# Altium project ESP32-C3FH4-v1.2.PrjPcb
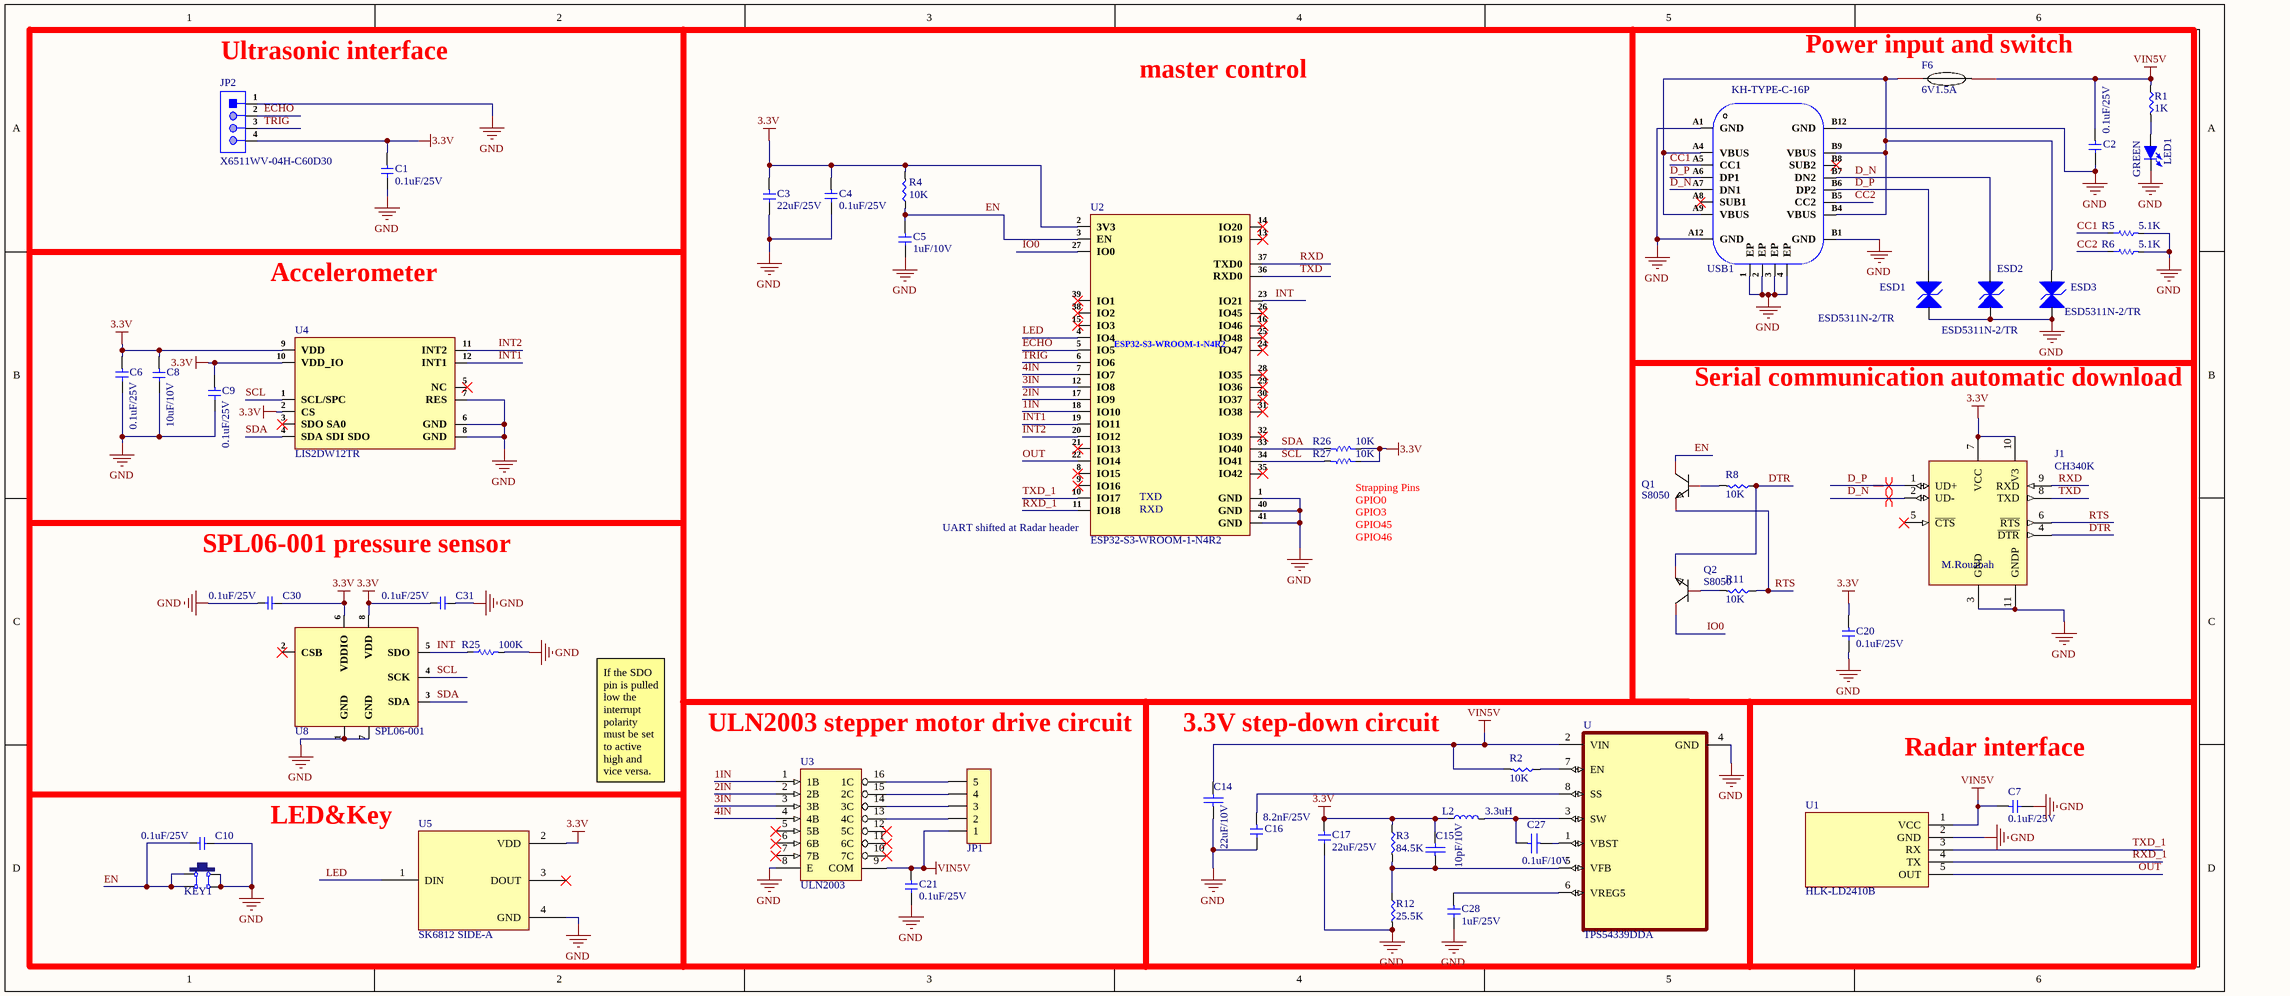
[diagram p0: ESP32-C3FH4.SchDoc]
1 sheet, 52 parts. Net scope: global (net labels, ports and power ports of the same name join across sheets).
Board file: ESP32-C3FH4-v1.2.PcbDoc

## Sheet ESP32-C3FH4.SchDoc
size 457 x 203 mm

### Parts
C1  0.1uF/25V  [C 0402_L]
C2  0.1uF/25V  [C 0402_L]
C3  22uF/25V  [C0805]
C4  0.1uF/25V  [C 0402_L]
C5  1uF/10V  [C 0402_L]
C6  0.1uF/25V  [C 0402_L]
C7  0.1uF/25V  [C 0402_L]
C8  10uF/10V  [C 0402_L]
C9  0.1uF/25V  [C 0402_L]
C10  0.1uF/25V  [C 0402_L]
C14  22uF/10V  [C 0402_L]
C15  10pF/10V  [C 0402_L]
C16  8.2nF/25V  [C 0402_L]
C17  22uF/25V  [C0805]
C20  0.1uF/25V  [C 0402_L]
C21  0.1uF/25V  [C 0402_L]
C27  0.1uF/10V  [C 0402_L]
C28  1uF/25V  [C 0402_L]
C30  0.1uF/25V  [C 0402_L]
C31  0.1uF/25V  [C 0402_L]
ESD1  ESD5311N-2/TR  [X1-DFN1006-2_L1.0-W0.6-RD]
ESD2  ESD5311N-2/TR  [X1-DFN1006-2_L1.0-W0.6-RD]
ESD3  ESD5311N-2/TR  [X1-DFN1006-2_L1.0-W0.6-RD]
F6  Name: 6V1.5A  [R 0805_L]  (hidden comment: 6V1A)
J1  CH340K  [*SOP100P600X160-11N]
JP1  HDR-1X5  [XH2.54-LI-5P]  (value not drawn)
JP2  X6511WV-04H-C60D30  [HDR1X4_]
KEY1  6*6*5  [TSW SMD-6*6*5]  (value not drawn)
L2  3.3uH  [VLS5045EX-3R3N]
LED1  GREEN  [LED 0603B]
Q1  S8050  [SOT23-3L]
Q2  S8050  [SOT23-3L]
R1  1K  [R 0402_L]
R2  10K  [R 0402_L]
R3  84.5K  [R 0402_L]
R4  10K  [R 0402_L]
R5  5.1K  [Res-0402]
R6  5.1K  [Res-0402]
R8  10K  [R 0402_L]
R11  10K  [R 0402_L]
R12  25.5K  [R 0402_L]
R25  100K  [Res-0402]
R26  10K  [R 0402_L]
R27  10K  [R 0402_L]
U  TPS54339DDA  [VREG_LM5017MR/NOPB]
U1  HLK-LD2410B  [HDR-TH_5P-P1.27-V-M]
U2  ESP32-S3-WROOM-1-N4R2  [41-SMD Module]
U3  ULN2003  [SOP16]
U4  LIS2DW12TR  [12-LGA (2x2)]
U5  SK6812 SIDE-A  [SK6812 SIDE-A]
U8  SPL06-001  [SPL06-001]
USB1  KH-TYPE-C-16P  [KH-TYPE-C-16P]

### Nets
3.3V: C1.1 C3.1 C4.1 C6.1 C8.1 C9.1 C15.2 C17.1 C20.1 C30.2 C31.1 J1.7(VCC) J1.10(V3) JP2.4 L2.1 R3.1 R4.2 R26.1 R27.1 U2.2(3V3) U4.2(CS) U4.9(VDD) U4.10(VDD_IO) U5.2(VDD) U8.6(VDDIO) U8.8(VDD)
GND: C1.2 C2.2 C3.2 C4.2 C5.2 C6.2 C7.2 C8.2 C9.2 C10.2 C14.1 C16.2 C17.2 C20.2 C21.2 C28.2 C30.1 C31.2 ESD1.1(K1) ESD2.1(K1) ESD3.1(K1) J1.3(GND) J1.11(GNDP) JP2.1 KEY1.1 KEY1.4 LED1.2(K) R5.2 R6.2 R12.2 R25.2 U.4(GND) U1.2(GND) U2.1(GND) U2.40(GND) U2.41(GND) U3.8(E) U4.6(GND) U4.7(RES) U4.8(GND) U5.4(GND) U8.1(GND) U8.7(GND) USB1.1(EP) USB1.2(EP) USB1.3(EP) USB1.4(EP) USB1.A1(GND) USB1.A12(GND) USB1.B1(GND) USB1.B12(GND)
VIN5V: C2.1 C7.1 C14.2 C21.1 F6.1 JP1.1 R1.1 R2.2 U.2(VIN) U1.1(VCC) U3.9(COM)
1IN: U2.18(IO10) U3.1(1B)
2IN: U2.17(IO9) U3.2(2B)
3IN: U2.12(IO8) U3.3(3B)
4IN: U2.7(IO7) U3.4(4B)
CC1: R5.1 USB1.A5(CC1)
CC2: R6.1 USB1.B5(CC2)
D_N: ESD2.2(K2) J1.2(UD-) USB1.A7(DN1) USB1.B7(DN2)
D_P: ESD1.2(K2) J1.1(UD+) USB1.A6(DP1) USB1.B6(DP2)
DTR: J1.4(~{DTR}) Q2.2(E) R8.1
ECHO: JP2.2 U2.5(IO5)
EN: C5.1 C10.1 KEY1.2 KEY1.3 Q1.3(C) R4.1 U2.3(EN)
INT: R25.1 U2.23(IO21) U8.5(SDO)
INT1: U2.19(IO11) U4.12(INT1)
INT2: U2.20(IO12) U4.11(INT2)
IO0: Q2.3(C) U2.27(IO0)
LED: U2.4(IO4) U5.1(DIN)
OUT: U1.5(OUT) U2.22(IO14)
RTS: J1.6(~{RTS}) Q1.2(E) R11.1
RXD: J1.9(RXD) U2.37(TXD0)
RXD_1: U1.4(TX) U2.11(IO18)
SCL: R27.2 U2.34(IO41) U4.1(SCL/SPC) U8.4(SCK)
SDA: R26.2 U2.33(IO40) U4.4(SDA_SDI_SDO) U8.3(SDA)
TRIG: JP2.3 U2.6(IO6)
TXD: J1.8(TXD) U2.36(RXD0)
TXD_1: U1.3(RX) U2.10(IO17)
NetC15_1: C15.1 R3.2 R12.1 U.5(VFB)
NetC16_1: C16.1 U.8(SS)
NetC27_1: C27.1 U.1(VBST)
NetC27_2: C27.2 L2.2 U.3(SW)
NetC28_1: C28.1 U.6(VREG5)
NetESD3_2: ESD3.2(K2) F6.2 USB1.A4(VBUS) USB1.A9(VBUS) USB1.B4(VBUS) USB1.B9(VBUS)
NetJP1_2: JP1.2 U3.13(4C)
NetJP1_3: JP1.3 U3.14(3C)
NetJP1_4: JP1.4 U3.15(2C)
NetJP1_5: JP1.5 U3.16(1C)
NetLED1_1: LED1.1(A) R1.2
NetQ1_1: Q1.1(B) R8.2
NetQ2_1: Q2.1(B) R11.2
NetR2_1: R2.1 U.7(EN)

Not connected (* = marked no-connect by the designer): J1 5(~{CTS})*; U2 8(IO15)* 9(IO16)* 13(IO19)* 14(IO20)* 15(IO3)* 16(IO46)* 21(IO13)* 24(IO47)* 25(IO48)* 26(IO45)* 28(IO35)* 29(IO36)* 30(IO37)* 31(IO38)* 32(IO39)* 35(IO42)* 38(IO2)* 39(IO1)*; U3 5(5B)* 6(6B)* 7(7B)* 10(7C)* 11(6C)* 12(5C)*; U4 3(SDO_SA0)* 5(NC)*; U5 3(DOUT)*; U8 2(CSB)*; USB1 A8(SUB1)* B8(SUB2)*

### Layout directives
differential pair; Impedance Constraint: Min = 88  Max = 90; Matched Net Lengths: Tolerance = 20 mil; net class USB; differential pair class USB_Lines: D_P
differential pair; Impedance Constraint: Min =88 Max = 90; Matched Net Lengths: Tolerance = 20 mil; net class USB; differential pair class USB_Lines: D_N

### Notes on the sheet
- (near JP2) Ultrasonic interface
- master control
- (near F6) Power input and switch
- Accelerometer
- Serial communication automatic download
- (near U2) TXD
- (near U2) RXD
- SPL06-001 pressure sensor
- (near U2) UART shifted at Radar header
- Strapping Pins
  GPIO0
  GPIO3
  GPIO45
  GPIO46
- ULN2003 stepper motor drive circuit
- 3.3V step-down circuit
- Radar interface
- LED&Key
- If the SDO
  pin is pulled low the interrupt polarity must be set to active high and vice versa.
- (in symbol CH340K) M.Rouabah

### Library data of the parts
C1-C9 C16 C17 C20 C21 C28 = C
C10 C30 C31 = Capacitor
C14 C15 C27 = Cap: Capacitor; Manufacturer: Generic Components; Class: Passive; Value: 15P; Published: 08/06/2000; Publisher: Altium Hobart Technology Centre; SubClass: Capacitor
ESD1-ESD3 = tvs管
F6 = JK-SMD0603-100L: Manufacturer: Jinrui Electronic Materials Co.; Convert to PCB: yes; Origin Footprint: F0603; Symbol: 6V1A; Device: JK-SMD0603-100L; Supplier: LCSC; Supplier Part: C516069; Manufacturer Part: JK-SMD0603-100L; JLCPCB Part Class: Extended Part; Add into BOM: yes
J1 = CH340K: USB to Serial Port Chip; MF: WCH; SnapEDA_Link: https://www.snapeda.com/parts/CH340K/WCH/view-part/?ref=snap; Package: Package; Value: *; MP: CH340K; Check_prices: https://www.snapeda.com/parts/CH340K/WCH/view-part/?ref=eda
JP1 = Header 5: 5P接插件; 版权归属: 源创客; BOM名称: 5P接插件; 学习资源: www.ooocke.com
JP2 = X6511WV-04H-C60D30: Gold 250V 3A Straight Square Pins 2.5mm 4P 260℃ 6mm -40℃~+105℃ 3mm 2.54mm Plugin Black Brass 1x4P Plugin,P=2.54mm Pin Headers ROHS; Manufacturer: XKB; Item Type: Male Header; ComponentLink1Description: LCSC; ComponentLink1URL: https://www.lcsc.com/product-detail/Pin-Headers_XKB-Connectivity-X6511WV-04H-C60D30_C706876.html; Manufacturer Part Number: X6511WV-04H-C60D30; Package: Plugin,P=2.54mm; LCSC Part Number: C706876
KEY1 = TSW DIP-6x6: 直插6x6轻触开关; 版权归属: 源创客; BOM名称: 直插6x6轻触开关; 学习资源: www.ooocke.com
L2 = VLS5045EX-3R3N: FIXED IND 3.3UH 4.2A 35.1MOHM SM; Manufacturer: TDK; Core Material: Ferrite; Saturation Current: 5.2A; Shielding: Shielded; DC Resistance (DCR): 35.1mR; Test Frequency: 100kHz; Tolerance: 30%; Item Type: Inductor; Supplier: Digi-Key; Supplier Part Number: 445-174398-1-ND; Manufacturer Part Number: VLS5045EX-3R3N; RoHS: Yes; Category: Fixed Inductors; Stock: 140631; Pricing: 1=0.42, 10=0.371, 25=0.3448, 50=0.2916, 100=0.2651, 250=0.2492, 500=0.2227 (USD); Mounting Technology: Surface Mount; Case/Package: Nonstandard; Min Operating Temperature: -40°C; Max Operating Temperature: 105°C; Packaging: Cut Tape; Value: 3.3uH; Series: VLS-EX; RoHS Compliant: Yes; ComponentLink1URL: http://www.farnell.com/datasheets/2339796.pdf?src-supplier=Farnell; ComponentLink1Description: http://www.farnell.com/datasheets/2339796.pdf?src-supplier=Farnell; ComponentLink2URL: https://media.digikey.com/pdf/Data%20Sheets/TDK%20PDFs/VLS-EX_Series_Br.pdf?src-supplier=Digi-Key; ComponentLink2Description: https://media.digikey.com/pdf/Data%20Sheets/TDK%20PDFs/VLS-EX_Series_Br.pdf?src-supplier=Digi-Key; ComponentLink3URL: http://www.farnell.com/datasheets/2339796.pdf?src-supplier=Element14; ComponentLink3Description: http://www.farnell.com/datasheets/2339796.pdf?src-supplier=Element14; ComponentLink4URL: http://www.farnell.com/datasheets/2339796.pdf?src-supplier=Newark; ComponentLink4Description: http://www.farnell.com/datasheets/2339796.pdf?src-supplier=Newark; LCSC Part Number: C307875
LED1 = LED-SH-5MM: 5mm草帽LED; 版权归属: 源创客; BOM名称: 5mm草帽LED; 学习资源: www.ooocke.com
Q1 Q2 = S8050: Manufacturer: WPMtek(维攀微); Convert to PCB: yes; Origin Footprint: SOT-23-3_L2.9-W1.3-P1.90-LS2.4-BR; Name: S8050; Symbol: S8050; Device: S8050; Supplier: LCSC; Supplier Part: C2688231; Manufacturer Part: S8050; Add into BOM: yes
R1-R4 R8 R11 R12 = Res
R5 R6 = RC0402FR-075K1L: RES 5.1K OHM 1% 1/16W 0402; Manufacturer: Yageo; Power Rating: 63mW; Resistance: 5.1kR; Temperature Coefficient: 100ppm/°C; Voltage Rating: 50V; Item Type: Resistor; Supplier 1: Avnet; Manufacturer Part Number: RC0402FR-075K1L; RoHS: Yes; Category: Chip SMD Resistors; Stock 1: 65000; Pricing 1: 10000=0.00085 (USD); Case/Package: 0402; Case Code (Metric): 1005; Case Code (Imperial): 0402; Min Operating Temperature: -55°C; Max Operating Temperature: 155°C; Tolerance: 1%; Technology: THICK FILM; Packaging: Tape and Reel; Package Quantity: 1; Resistor Type: Thick Film; Number of Terminations: 2; Termination: SMD/SMT; Max Power Dissipation: 63mW; Voltage Rating (DC): 50V; Working Voltage: 50V; Features: Moisture Resistant; Series: RC; Resistance Tolerance: 1%; Construction: Rectangular; Length: 1mm; Width: 0.02inch; Height: 0.016inch; Depth: 0.5mm; RoHS Compliant: Yes; Military Standard: Not; Lead Free: Lead Free; ComponentLink1URL: https://datasheet.ciiva.com/7983/1018594-7983519.pdf?src-supplier=Element14; ComponentLink1Description: https://datasheet.ciiva.com/7983/1018594-7983519.pdf?src-supplier=Element14; ComponentLink2URL: https://datasheet.ciiva.com/46394/1018594-46394936.pdf?src-supplier=Element14; ComponentLink2Description: https://datasheet.ciiva.com/46394/1018594-46394936.pdf?src-supplier=Element14; ComponentLink3URL: https://datasheet.ciiva.com/2453/pyu-r-int-thick-7-2453401.pdf?src-supplier=Digi-Key; ComponentLink3Description: https://datasheet.ciiva.com/2453/pyu-r-int-thick-7-2453401.pdf?src-supplier=Digi-Key; ComponentLink4URL: https://datasheet.ciiva.com/2453/pyu-r-int-thick-7-2453402.pdf?src-supplier=Digi-Key; ComponentLink4Description: https://datasheet.ciiva.com/2453/pyu-r-int-thick-7-2453402.pdf?src-supplier=Digi-Key; ComponentLink5URL: https://datasheet.ciiva.com/2453/pyu-r-int-thick-7-2453400.pdf?src-supplier=Digi-Key; ComponentLink5Description: https://datasheet.ciiva.com/2453/pyu-r-int-thick-7-2453400.pdf?src-supplier=Digi-Key; ComponentLink6URL: https://datasheet.ciiva.com/12558/pyu-rc0402-51-rohs-l-6-r-8721-12558460.pdf?src-supplier=Mouser; ComponentLink6Description: https://datasheet.ciiva.com/12558/pyu-rc0402-51-rohs-l-6-r-8721-12558460.pdf?src-supplier=Mouser; ComponentLink7URL: https://datasheet.ciiva.com/16744/pyu-rc0402-51-rohs-l-6-r-16744283.pdf?src-supplier=Future+Electronics; ComponentLink7Description: https://datasheet.ciiva.com/16744/pyu-rc0402-51-rohs-l-6-r-16744283.pdf?src-supplier=Future+Electronics; ComponentLink8URL: https://datasheet.ciiva.com/15189/getdatasheetpartid-323636-15189493.pdf?src-supplier=Verical; ComponentLink8Description: https://datasheet.ciiva.com/15189/getdatasheetpartid-323636-15189493.pdf?src-supplier=Verical; Supplier Part Number 1: RC0402FR-075K1L; LCSC Part Number: C105872
R25 = RC0402FR-07100KL: RES 100K OHM 1% 1/16W 0402; Manufacturer: Yageo; Resistance: 100kR; Temperature Coefficient: 100ppm/°C; Power Rating: 63mW; Voltage Rating: 50V; Item Type: Resistor; Supplier 1: Mouser; Manufacturer Part Number: RC0402FR-07100KL; RoHS: Yes; Category: Chip SMD Resistors; Stock 1: 7759549; Pricing 1: 1=0.10000, 10=0.01200, 50=0.01200, 100=0.00500, 1000=0.00300, 2500=0.00200, 10000=0.00100 (USD); Case/Package: 0402; Case Code (Metric): 1005; Case Code (Imperial): 0402; Min Operating Temperature: -55°C; Max Operating Temperature: 155°C; Resistor Type: Thick Film; Tolerance: 1%; Packaging: Tape and Reel; Package Quantity: 1; Number of Terminations: 2; Termination: SMD/SMT; Max Power Dissipation: 63mW; Working Voltage: 50V; Features: Moisture Resistant; Series: RC; Resistance Tolerance: 1%; Construction: Rectangular; Technology: THICK FILM; Length: 0.039inch; Width: 0.02inch; Height: 0.016inch; Depth: 0.5mm; REACH SVHC: No SVHC; Lead Free: Lead Free; RoHS Compliant: Yes; Military Standard: Not; ComponentLink1URL: https://datasheet.ciiva.com/11819/0900766b80c66297-11819452.pdf?src-supplier=RSComponents; ComponentLink1Description: https://datasheet.ciiva.com/11819/0900766b80c66297-11819452.pdf?src-supplier=RSComponents; ComponentLink2URL: https://datasheet.ciiva.com/22747/1018594-22747509.pdf?src-supplier=Element14; ComponentLink2Description: https://datasheet.ciiva.com/22747/1018594-22747509.pdf?src-supplier=Element14; ComponentLink3URL: https://datasheet.ciiva.com/2453/pyu-r-int-thick-7-2453362.pdf?src-supplier=Digi-Key; ComponentLink3Description: https://datasheet.ciiva.com/2453/pyu-r-int-thick-7-2453362.pdf?src-supplier=Digi-Key; ComponentLink4URL: https://datasheet.ciiva.com/2453/pyu-r-int-thick-7-2453363.pdf?src-supplier=Digi-Key; ComponentLink4Description: https://datasheet.ciiva.com/2453/pyu-r-int-thick-7-2453363.pdf?src-supplier=Digi-Key; ComponentLink5URL: https://datasheet.ciiva.com/2453/pyu-r-int-thick-7-2453361.pdf?src-supplier=Digi-Key; ComponentLink5Description: https://datasheet.ciiva.com/2453/pyu-r-int-thick-7-2453361.pdf?src-supplier=Digi-Key; ComponentLink6URL: https://datasheet.ciiva.com/12667/pyu-rc0402-51-rohs-l-6-r-12667930.pdf?src-supplier=Mouser; ComponentLink6Description: https://datasheet.ciiva.com/12667/pyu-rc0402-51-rohs-l-6-r-12667930.pdf?src-supplier=Mouser; ComponentLink7URL: https://datasheet.ciiva.com/15189/getdatasheetpartid-323696-15189334.pdf?src-supplier=Verical; ComponentLink7Description: https://datasheet.ciiva.com/15189/getdatasheetpartid-323696-15189334.pdf?src-supplier=Verical; Supplier Part Number 1: 603-RC0402FR-07100KL; LCSC Part Number: C60491
R26 R27 = Resistor
U = TPS54339EDDA: 4.5V to 23V Input, 3A Synchronous Step-Down Converter with D-CAP2 Mode and Light Load Efficiency 8-SO PowerPAD -40 to 85; MF: Texas Instruments; MP: TPS54339EDDA; Value: *; Package: HSOIC-8 Texas Instruments; Price: None; Availability: Unavailable; SnapEDA_Link: https://www.snapeda.com/parts/TPS54339EDDA/Texas%20Instruments/view-part/1156774/?ref=snap
U2 = ESP32-S3-WROOM-1-N4R2: SMD,18x25.5mm WiFi Modules ROHS; Manufacturer: Espressif Systems; Item Type: Module; Manufacturer Part Number: ESP32-S3-WROOM-1-N4R2; RoHS: No; Category: Uncategorized; ComponentLink1Description: LCSC; ComponentLink1URL: https://www.lcsc.com/product-detail/WiFi-Modules_Espressif-Systems-ESP32-S3-WROOM-1-N4R2_C2913203.html; LCSC Part Number: C2913203; Supplier 1: Digikey; Supplier Part Number 1: 1965-ESP32-S3-WROOM-1-N4R2CT-ND
U3 = ULN2003-2: 达林顿驱动芯片; 版权归属: 源创客; BOM名称: 达林顿驱动芯片; 学习资源: www.ooocke.com
U4 = LIS2DW12TR: ACCEL 2-16G I2C/SPI 12LGA; Manufacturer: STMicroelectronics; Output Type: SPI,I2C; Axis: X, Y, Z; Bandwidth: 400Hz; Item Type: IC; Supplier: Mouser; Supplier Part Number: 511-LIS2DW12TR; Manufacturer Part Number: LIS2DW12TR; RoHS: Yes; Category: Accelerometers; Stock: 14817; Pricing: 1=2.65, 10=2.16, 50=2.16, 100=1.54, 1000=1.21, 10000=0.988 (USD); Mounting Technology: Surface Mount; Case/Package: LGA; Pins: 12; Min Operating Temperature: -40°C; Max Operating Temperature: 85°C; Packaging: Cut Tape; Series: -; RoHS Compliant: Yes; ComponentLink1URL: http://www.farnell.com/datasheets/2581666.pdf?src-supplier=Farnell; ComponentLink1Description: http://www.farnell.com/datasheets/2581666.pdf?src-supplier=Farnell; LCSC Part Number: C189624
U5 = SK6812 SIDE-A: INTEGRATED LIGHT SOURCE INTELLIGENT CONTROL OF / CHIP-ON-TOP SMD TYPE LED
U8 = SPL06-001: LGA-8(2x2.5) Pressure Sensors ROHS; Manufacturer: Goertek; Item Type: Sensor; Manufacturer Part Number: SPL06-001; Package: LGA-8(2x2.5); LCSC Part Number: C2684428
USB1 = KH-TYPE-C-16P: 3A 1 Surface Mount，Right Angle 16P Female -40℃~+85℃ Type-C SMD USB Connectors ROHS; Manufacturer: Shenzhen Kinghelm Elec; Manufacturer Part Number: KH-TYPE-C-16P; Package: SMD; LCSC Part Number: C709357; Item Type: Type-C SMD USB; ComponentLink1Description: LCSC; ComponentLink1URL: https://www.lcsc.com/product-detail/USB-Connectors_Shenzhen-Kinghelm-Elec-KH-TYPE-C-16P_C709357.html